# EasyEDA Pro project ProPrj_SensUs2026_ParisBioTek_PCBs.epro, board PCB_2
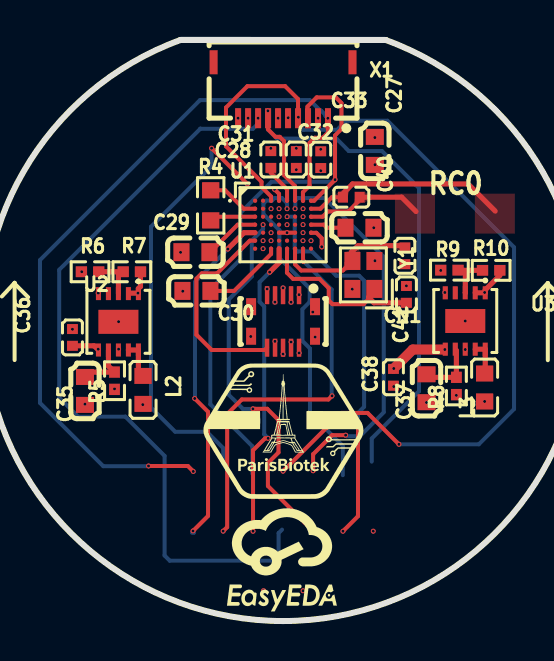
[diagram p4: board, top side]
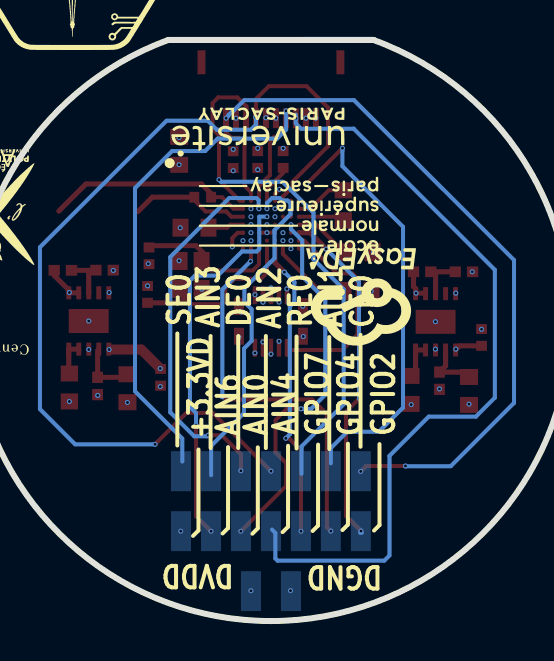
[diagram p5: board, bottom side, seen from below]

Outline 10.28 x 29.1 mm; copper layers: Top Layer, Inner1, Inner2, Inner3, Inner4, Bottom Layer. Coordinates in mm from the lower left corner of the outline.
Outline path: 0,29.1 10.28,29.09 ; 10.27,29.1 0.01,29.1 arc(5.14,0) 10.27,29.1
Stack: Top Layer 0.035mm Outer layer thickness 1oz / Dielectric1 0.0994mm 3313 RC57% 4.2mil / Inner1 0.0152mm Inner layer thickness / Dielectric2 0.55mm 0.55mm H/H No copper / Inner2 0.0152mm Inner layer thickness / Dielectric3 0.1088mm 2116 RC54% 4.9mil / Inner3 0.0152mm Inner layer thickness / Dielectric4 0.55mm 0.55mm H/H No copper / Inner4 0.0152mm Inner layer thickness / Dielectric5 0.0994mm 3313 RC57% 4.2mil / Bottom Layer 0.035mm Outer layer thickness 1oz

## Design rules (mm)
template: Custom Config
spacing copperThickness1oz (default): track to track 0.102, other pairs 0.14 to 0.3
spacing copperThickness2oz: track to track 0.203, other pairs 0.152 to 0.3
spacing copperThicknessInner0.5oz: track to track 0.089, other pairs 0.152 to 0.3
track width copperThickness1oz (default): min 0.102, default 0.254, max 2.54
track width copperThickness2oz: min 0.203, default 0.254, max 2.54
track width copperThickness0.5oz: min 0.089, default 0.254, max 2.54
differential pair differentialPair (default): width min 0.127, default 0.254, max 2.54; gap min 0.152, default 0.152
via viaSize (default): diameter min 0.2, default 0.25, max 10; hole min 0.1, default 0.15, max 6.3

## Placement (name value [footprint] x y rotation side)
C27  470nF  [C0603]  9.74 23.54 90 top
C28  4.7uF  [C0402]  4.53 23.11 270 top
C29  470nF  [C0603]  0.76 18.47 0 top
C30  470nF  [C0603]  0.81 16.53 180 top
C31  100nF  [C0402]  5.81 23.11 270 top
C32  100nF  [C0402]  7.03 23.1 270 top
C33  100nF  [C0402]  8.56 21.22 180 top
C34  470nF  [C0603]  8.97 19.69 0 top
C35  470nF  [C0603]  -4.77 11.52 270 top
C36  4.7uF  [C0402]  -5.4 14.2 270 top
C37  470nF  [C0603]  12.32 11.66 270 top
C38  4.7uF  [C0402]  10.67 12.21 90 top
C40  15pF  [C0402]  11.24 18.29 270 top
C41  15pF  [C0402]  11.32 16.36 90 top
CN1  559099872  [CONN-SMD_559099872]  5.14 15 180 top
L2  BLM18PG600SN1D  [L0603]  -1.86 11.57 270 top
L3  BLM18PG600SN1D  [L0603]  15.23 11.69 270 top
R4  100Ω  [R0603]  1.52 20.81 270 top
R5  33kΩ  [R0402]  -3.29 12.03 270 top
R6  33kΩ  [R0402]  -4.52 17.49 0 top
R7  47kΩ  [R0402]  -2.42 17.49 0 top
R8  33kΩ  [R0402]  13.82 11.77 270 top
R9  33kΩ  [R0402]  13.47 17.57 0 top
R10  47kΩ  [R0402]  15.56 17.56 0 top
U1  AD5940BCBZ-RL7  [BGA-56_L4.2-W3.6-R8-C7-P0.40-TL]  5.14 19.85 0 top
U2  LT3045EDD#TRPBF  [DFN-10_L3.0-W3.0-P0.50-BL-EP]  -3.1 14.98 180 top
U3  LT3045EDD#TRPBF  [DFN-10_L3.0-W3.0-P0.50-BL-EP]  14.26 15.02 180 top
X1  AFC48-S10FKA-HF  [FPC-SMD_AFC48-S10FKA-HF]  5.14 26.58 180 top
Y1  32MHz  [CRYSTAL-SMD_4P-L2.0-W1.6-BL]  9.16 17.33 90 top

## Footprints (pads in the part's own frame, mm; a bottom-side part is the same pattern mirrored in y, then rotated)
BGA-56_L4.2-W3.6-R8-C7-P0.40-TL
  round 0.213 smd: A1(-1.4,1.2) A2(-1,1.2) A3(-0.6,1.2) A4(-0.2,1.2) A5(0.2,1.2) A6(0.6,1.2) A7(1,1.2) A8(1.4,1.2) B1(-1.4,0.8) B2(-1,0.8) B3(-0.6,0.8) B4(-0.2,0.8) B5(0.2,0.8) B6(0.6,0.8) B7(1,0.8) B8(1.4,0.8) C1(-1.4,0.4) C2(-1,0.4) C3(-0.6,0.4) C4(-0.2,0.4) C5(0.2,0.4) C6(0.6,0.4) C7(1,0.4) C8(1.4,0.4) D1(-1.4,0) D2(-1,0) D3(-0.6,0) D4(-0.2,0) D5(0.2,0) D6(0.6,0) D7(1,0) D8(1.4,0) E1(-1.4,-0.4) E2(-1,-0.4) E3(-0.6,-0.4) E4(-0.2,-0.4) E5(0.2,-0.4) E6(0.6,-0.4) E7(1,-0.4) E8(1.4,-0.4) F1(-1.4,-0.8) F2(-1,-0.8) F3(-0.6,-0.8) F4(-0.2,-0.8) F5(0.2,-0.8) F6(0.6,-0.8) F7(1,-0.8) F8(1.4,-0.8) G1(-1.4,-1.2) G2(-1,-1.2) G3(-0.6,-1.2) G4(-0.2,-1.2) G5(0.2,-1.2) G6(0.6,-1.2) G7(1,-1.2) G8(1.4,-1.2)
C0402
  rect 0.5x0.54 smd: 1(-0.42,0) 2(0.42,0)
C0603
  rect 0.8x0.9 smd: 1(-0.7,0) 2(0.7,0)
CONN-SMD_559099872
  rect 0.22x0.9 smd: 1(-0.8,-1.315) 2(-0.4,-1.315) 3(0,-1.315) 4(0.4,-1.315) 5(0.8,-1.315) 6(0.8,1.315) 7(0.4,1.315) 8(0,1.315) 9(-0.4,1.315) 10(-0.8,1.315)
  rect 0.5x0.85 smd: 11(-1.6,0.74) 12(-1.6,-0.74) 13(1.6,-0.74) 14(1.6,0.74)
CRYSTAL-SMD_4P-L2.0-W1.6-BL
  rect 0.9x0.8 smd: 1(-0.7,-0.55) 2(0.7,-0.55) 3(0.7,0.55) 4(-0.7,0.55)
DFN-10_L3.0-W3.0-P0.50-BL-EP
  rect 0.25x0.65 smd: 1(-1,-1.411) 2(-0.5,-1.411) 3(0,-1.411) 4(0.5,-1.411) 5(1,-1.411) 6(1,1.411) 7(0.5,1.411) 8(0,1.411) 9(-0.5,1.411) 10(-1,1.411)
  rect 2x1.2 smd: 11(0,0)
FPC-SMD_AFC48-S10FKA-HF
  rect 0.3x1 smd: 1(-2.25,1.4) 2(-1.75,1.4) 3(-1.25,1.4) 4(-0.75,1.4) 5(-0.25,1.4) 6(0.25,1.4) 7(0.75,1.4) 8(1.25,1.4) 9(1.75,1.4) 10(2.25,1.4)
  rect 0.4x1.2 smd: 11(-3.475,-1.4) 12(3.475,-1.4)
L0603
  rect 0.8x0.864 smd: 1(-0.7,0) 2(0.7,0)
R0402
  rect 0.566x0.54 smd: 1(-0.433,0) 2(0.433,0)
R0603
  rect 0.806x0.864 smd: 1(-0.753,0) 2(0.753,0)

## Nets
As in the schematic.

Pads without a net: U1 A1 A2 B2 C2 C3 D3 D4 G1 G8; U2 4; U3 4; X1 11 12

## Via types
v1: diameter 0.25, hole 0.15, Top Layer to Bottom Layer, 103 vias

## Routing (per net, layer and track width the routed paths; a pad name or vN(x,y) marks a point on that pad's centre or on a via; arc(x,y) is an arc through that point)
+3.3VA: length 25.1
  Top Layer w0.102: -2.57,16.42 U2.2
  Top Layer w0.255: C36.2 -4.31,13.78 U2.6 ; v1(-2.12,16.42) -2.57,16.42 ; U2.1 -2.1,16.64 -1.99,16.75 -1.99,17.49
  Inner2 w0.5: v1(-2.12,16.42) -2.57,16.42 -4.07,14.92 -4.07,13.65 v1(-4.11,13.61) -4.11,10.07 -3.68,9.64 0.72,9.64 1.83,10.75 1.83,14.09 2.7,14.96 5.01,14.96 5.54,15.5 v1(5.54,15.97)
+3.3VD: length 25.6
  Top Layer w0.255: R10.2 15.99,17.31 15.26,16.58 U3.1 U3.2
  Top Layer w0.5: 13.13,13.6 11.63,13.6 v1(10.68,12.65)
  Inner2 w0.2: 10.72,12.65 11.48,11.88 11.48,6.32 v1(9.66,4.5)
  Inner2 w0.255: v1(13.24,13.6) 13.14,13.7 13.14,14.78 13.92,15.56 14.34,15.56 v1(15.23,16.45)
  Inner2 w0.5: v1(10.68,12.65) 4.76,12.65 4.35,13.06 4.35,13.62 v1(4.74,14.01)
AGND:
  vias: v1(-5.4,14.61) v1(-4.93,17.49) v1(-4.77,10.86) v1(-4.11,16.42) v1(-3.29,11.62) v1(-3.09,14.99) v1(-3.09,13.61) v1(0.01,18.46) v1(4.53,23.67) v1(4.54,19.45) v1(4.94,20.25) v1(5.34,19.85) v1(5.81,23.67) v1(7.03,23.62) v1(9.68,19.69) v1(9.74,24.21)
AVDD: length 16.1
  Top Layer w0.2: v1(4.72,21.62) 4.94,21.39 U1.A4
  Inner2 w0.2: v1(4.14,19.05) 3.66,19.52
  Inner2 w0.5: 2.36,19.52 3.66,19.52 3.66,19.58 3.56,19.69 3.56,20.82 4.35,21.62 v1(4.72,21.62) ; v1(-1.88,10.84) -0.95,11.77 -0.95,16.65 1.94,19.53 2.32,19.53 2.33,19.54
DGND: length 0.8
  Top Layer w0.2: U1.E4 v1(5.34,19.45) U1.E6
  vias: v1(0.13,16.52) v1(3.55,15.77) v1(3.53,14.25) v1(4.17,1.52) v1(4.35,16.63) v1(5.55,13.97) v1(5.95,13.42) v1(6.63,15.47) v1(6.75,14.22) v1(8.61,16.62) v1(9.74,18.04) v1(10.68,11.74) v1(11.28,17.89) v1(11.32,16.78) v1(12.32,10.94) v1(13.03,17.56) v1(13.24,16.45) v1(13.81,11.3) v1(14.26,15.02) v1(14.26,13.6)
DVDD: length 29.3
  Inner2 w0.2: v1(4.14,18.65) 4.54,18.65 v1(4.54,19.05) ; v1(6.15,1.52) 8.85,1.52 12.23,4.9 12.23,7.99 v1(15.23,10.99)
  Inner2 w0.5: 4.64,18.54 8.4,14.78 11.17,14.78 14.95,10.99 v1(15.23,10.99)
AIN0: length 27.9
  Top Layer w0.2: v1(3.64,10.63) 4.35,10.63 4.92,10.06 4.92,8.44 4.39,7.91 4.39,6.76 v1(6.65,4.5)
  Inner3 w0.2: v1(4.14,19.85) 3.89,19.85 2.03,21.7 2.03,25.86 2.19,26.02 2.8,26.02 3.39,25.42 v1(3.39,25.18)
  Bottom Layer w0.2: 3.65,10.62 3.14,10.62 2.42,11.33 2.42,16.1 3.58,17.26 3.58,19.06 4.14,19.62 v1(4.14,19.85)
AIN1: length 32.7
  Top Layer w0.2: v1(3.36,21.89) 1.57,23.68
  Inner3 w0.102: v1(4.54,20.65) 4.54,20.7
  Inner3 w0.2: 4.54,20.7 4.46,20.7 3.36,21.8 v1(3.36,21.89) ; v1(6.89,25.18) 5.09,26.99 2.39,26.99 1.57,26.16 v1(1.57,23.68)
  Bottom Layer w0.2: v1(1.57,23.68) 1.57,22.77 -1.47,19.74 -1.47,10.69 -0.25,9.48 1.33,9.48 2.15,8.66 2.15,7.89
AIN2: length 47.2
  Top Layer w0.2: v1(10.94,8.85) 9.37,10.42 8.06,10.42 v1(5.14,7.5) ; X1.4 5.89,26.13 5.25,26.78 3.36,26.78 2.29,25.71 2.29,23.77 4.07,21.99 4.07,21.73 4.54,21.26 U1.A3
  Bottom Layer w0.2: v1(5.91,25.23) 5.89,25.21 5.89,24.85 6.15,24.6 7.85,24.6 8.3,25.05 10.37,25.05 16.7,18.72 16.7,10.61 14.94,8.85 v1(10.94,8.85)
AIN3: length 22
  Inner3 w0.102: 5.34,20.65 v1(5.34,20.65)
  Inner3 w0.2: v1(4.89,25.18) 4.89,23.84 4.91,23.83 4.91,21.99 5.34,21.56 5.34,20.65
  Bottom Layer w0.2: 5.17,17.97 6.47,16.66 6.47,15.98 6.11,15.61 6.11,14.03 6.49,13.65 6.49,10.39 ; 5.16,17.97 4.96,18.17 4.96,19.57 4.16,20.37 4.16,20.91 4.31,21.06 4.59,21.06 4.71,21.18 5.09,21.18 5.34,20.93 v1(5.34,20.65) ; 6.5,10.4 8.14,8.77 8.14,7.3
AIN4: length 43.7
  Inner3 w0.2: v1(3.89,25.18) 4.07,25 4.07,21.81 4.27,21.61 4.27,21.45 4.92,20.8 4.92,20.68 4.94,20.66
  Bottom Layer w0.2: v1(3.89,25.18) 3.9,25.18 ; 3.9,25.18 3.9,24.91 3.63,24.65 1,24.65 ; 3.9,25.18 3.9,25.35 ; 5.09,4.58 4.92,4.41 4.92,3.13 4.81,3.02 -0.53,3.02 -0.79,3.28 -0.79,8.27 -2.75,10.24 -5.12,10.24 -6.06,11.18 -6.06,17.59 1.01,24.66
  vias: v1(4.94,20.65)
AIN6: length 28.7
  Top Layer w0.2: v1(8.14,4.5) 8.89,5.25 v1(8.89,9.81)
  Inner3 w0.2: v1(2.89,25.18) 2.64,24.93 2.64,21.89 4.69,19.85 4.89,19.85 4.97,19.77 4.97,19.15 5.09,19.03 5.7,19.03 5.76,19.09 5.76,20.14 5.65,20.25 v1(5.34,20.25)
  Bottom Layer w0.2: v1(8.89,9.81) 8.89,10.42 9.2,10.72 9.2,17.04 8.95,17.29 7.81,17.29 6.59,18.51 5.86,18.51 5.73,18.63 5.73,20.24 5.72,20.25 v1(5.34,20.25)
CE0: length 39.3
  Top Layer w0.2: v1(0.65,7.49) 0.38,7.76 v1(-1.59,7.76) ; U1.A7 6.14,21.05 6.14,21.47 6.47,21.8 6.47,23.94 6.72,24.2 7.13,24.2 7.39,24.46 X1.1
  Bottom Layer w0.2: v1(7.39,25.18) 7.27,25.29 7.27,25.33 7.05,25.55 7.01,25.55 6.48,26.08 0.99,26.08 -7.02,18.07 -7.02,10.92 -3.85,7.75 -1.6,7.75 -1.59,7.74
CS: length 2.8
  Inner3 w0.2: v1(5.14,16.68) 5.64,17.18 5.64,18.2 6.14,18.7 v1(6.14,19.05)
DE0: length 23.9
  Top Layer w0.2: v1(8.28,9.31) 7.6,9.31 6.65,8.35 v1(6.65,7.52)
  Inner3 w0.2: v1(5.74,20.65) 5.74,21.79 5.4,22.13 v1(5.4,25.2)
  Bottom Layer w0.2: v1(8.28,9.31) 8.33,9.25 8.98,9.25 10.18,10.45 10.18,18.23 7.23,21.18 5.87,21.18 5.76,21.07 5.76,20.66 v1(5.74,20.65)
GPIO2: length 17.2
  Top Layer w0.2: v1(0.72,11.15) 1.39,10.48 1.39,5.26 v1(0.64,4.51)
  Top Layer w0.255: 2.38,18.64 3.19,19.45 U1.E1
  Bottom Layer w0.2: v1(0.72,11.15) 0.74,11.16 0.74,16.98 v1(2.38,18.63) ; 0.59,4.42 0.68,4.42
GPIO4: length 19.7
  Top Layer w0.2: U1.G7 6.14,18.03 v1(6.17,18.01) ; v1(7.6,11.28) 7.41,11.1 3.08,11.1 2.35,10.36 2.35,4.7 v1(2.15,4.5)
  Bottom Layer w0.2: v1(7.6,11.28) 7.6,11.23 7.58,11.21 7.58,16.6 v1(6.17,18.01)
GPIO7: length 15.1
  Top Layer w0.2: v1(4.4,9.15) 4.24,9.15 3.64,8.55 v1(3.64,4.5)
  Top Layer w0.255: v1(4.47,17.47) 4.94,17.94 U1.G4
  Bottom Layer w0.2: v1(4.4,9.15) 4.2,9.35 4.2,15.75 3.97,15.98 3.97,16.97 v1(4.47,17.47)
MISO: length 6.1
  Top Layer w0.2: 7.08,18.71 7.08,19.17 6.81,19.44 6.55,19.44 U1.E8
  Inner3 w0.2: v1(7.08,18.74) 7.08,16.82 5.82,15.57 5.14,15.57 v1(4.74,15.97)
MOSI: length 10.3
  Inner3 w0.2: v1(6.14,19.45) 7.28,19.45 7.64,19.08 7.64,13.39 ; v1(5.14,13.37) 5.75,12.76 7.03,12.76 7.64,13.37
RC0_0: length 6
  Top Layer w0.2: U1.C8 7.12,20.25 7.39,20.51 8.41,20.51 8.98,21.08 C33.1
  Top Layer w0.255: C33.1 11.08,21.22 11.8,20.5
RC0_1: length 10.5
  Top Layer w0.2: C33.2 7.59,21.22 7.01,20.65 U1.B8
  Top Layer w0.255: C33.2 8.07,21.3 8.07,21.33 8.62,21.89 14.4,21.89 15.76,20.53
RE0: length 28.2
  Top Layer w0.2: U1.A8 6.7,21.05 7.74,22.09 7.74,24.31 8.07,24.64 8.07,25.94 7.78,26.22 6.83,26.22 6.37,25.76 6.37,25.2 X1.3
  Bottom Layer w0.2: v1(7.75,22.1) 7.64,21.99 4.56,21.99 3.01,20.45 3.01,18.12 1.5,16.61 1.5,10.85 3.61,8.75 3.61,7.37
RESET: length 10.4
  Top Layer w0.2: CN1.6 4.23,13.57 1.57,13.57 0.81,14.34 0.81,17.14 1.07,17.41 1.84,17.41 3.48,19.05 U1.F1
SCLK: length 2.9
  Inner3 w0.2: 5.95,16.35 6.54,16.94 v1(6.54,19.05)
  vias: v1(5.94,16.34)
SE0: length 29.2
  Top Layer w0.2: X1.7 4.4,25.17 4.4,24.61 4.76,24.24 4.98,24.24 5.19,24.03 5.19,22.33 5.74,21.78 U1.A6
  Bottom Layer w0.2: v1(4.38,25.55) 4.38,24.61 4.84,24.16 7.81,24.16 8.44,23.53 10.09,23.53 11.95,21.68 11.95,11.51 9.58,9.14 9.58,7.98
X0: length 7.3
  Top Layer w0.2: Y1.3 8.14,17.55 6.05,17.55 5.74,17.86 U1.G6
  Top Layer w0.255: C40.1 11.15,18.8 8.9,18.8 8.56,18.46 8.56,18.08 Y1.3
X1: length 9.1
  Top Layer w0.102: Y1.1 9.71,16.51 9.42,16.21
  Top Layer w0.2: 9.42,16.21 9.42,16.11 9.17,15.87 7.61,15.87 7.43,16.05 7.43,16.67 6.97,17.13 5.65,17.13 5.34,17.44 U1.G5
  Top Layer w0.255: 9.42,16.21 9.69,15.94 C41.1
$1N2048: length 4.8
  Inner3 w0.2: v1(9.74,22.85) 9.47,22.85 6.47,19.85 v1(6.14,19.85)
$1N2152: length 1.9
  Top Layer w0.2: 4.53,22.56 4.53,22.44 5.34,21.63 U1.A5
$1N2188: length 2.9
  Top Layer w0.2: C29.2 1.49,18.47 2.87,19.85 U1.D1
$1N2486: length 4.1
  Top Layer w0.2: C30.1 2.69,16.53 4.54,18.38 U1.G3
$1N2550: length 2.1
  Inner3 w0.2: v1(6.14,20.65) 6.14,21.85 5.81,22.19 v1(5.81,22.6)
$1N3554: length 2.8
  Inner3 w0.2: v1(6.14,20.25) 6.36,20.25 7.03,20.92 v1(7.03,22.55)
$1N3572: length 2.6
  Top Layer w0.2: U1.B1 3.17,20.65 2.25,21.57 R4.1
$1N3580: length 2.3
  Top Layer w0.2: U1.C1 1.71,20.25 R4.2
$1N4271: length 1.8
  Top Layer w0.2: U1.D8 7.18,19.85 7.34,19.69 C34.1
$1N7940: length 1.9
  Top Layer w0.255: L2.1 -2.1,12.51 U2.10 U2.9
$1N7995: length 2.8
  Top Layer w0.255: C35.1 -4.53,12.47 R5.1 -3.6,12.77 U2.7
$1N8461: length 2.3
  Top Layer w0.102: -3.1,17.43 -3.04,17.49
  Top Layer w0.255: U2.3 -3.1,17.43 ; R6.2 R7.1
$1N8870: length 1.7
  Top Layer w0.102: 15.26,12.43 L3.1
  Top Layer w0.255: U3.9 U3.10 15.26,12.43
$1N8877: length 3
  Top Layer w0.102: 13.82,13.56 U3.7
  Top Layer w0.255: 13.82,13.56 R8.1 12.48,12.2 C37.1
$1N8893: length 2.3
  Top Layer w0.102: 14.21,17.52 14.25,17.56
  Top Layer w0.255: 14.21,17.52 14.27,17.47 14.27,16.44 U3.3 ; 14.25,17.56 R10.1 ; R9.2 14.16,17.57

## Copper pours and planes (outline as drawn; the poured copper is in the pictures)
+3.3VD on Bottom Layer: 9.14,5.5 10.14,5.5 10.14,3.5 9.14,3.5
AGND on Inner1: 19.84,15.35 19.8,16.07 19.73,16.8 19.63,17.51 19.48,18.23 19.31,18.93 19.1,19.62 18.85,20.31 18.58,20.98 18.27,21.63 17.92,22.27 17.55,22.89 17.15,23.5 16.72,24.08 16.26,24.64 15.77,25.18 15.26,25.69 14.72,26.18 14.16,26.64 13.58,27.07 12.97,27.47 12.35,27.84 11.71,28.19 11.06,28.5 10.39,28.77 9.7,29.02 9.01,29.23 8.3,29.41 7.59,29.55 6.88,29.65 6.15,29.72 5.43,29.76 4.7,29.76 3.98,29.72 3.26,29.65 2.54,29.55 1.83,29.41 1.13,29.23 0.43,29.02 -0.25,28.77 -0.92,28.5 -1.58,28.19 -2.22,27.84 -2.84,27.47 -3.44,27.07 -4.02,26.64 -4.58,26.18 -5.12,25.69 -5.63,25.18 -6.12,24.64 -6.58,24.08 -7.01,23.5 -7.42,22.89 -7.79,22.27 -8.13,21.63 -8.44,20.98 -8.72,20.31 -8.96,19.62 -9.17,18.93 -9.35,18.23 -9.49,17.51 -9.6,16.8 -9.67,16.07 -9.7,15.35 -9.7,14.63 -9.67,13.9 -9.6,13.18 -9.49,12.46 -9.35,11.75 -9.17,11.05 -8.96,10.35 -8.72,9.67 -8.44,9 -8.13,8.34 -7.79,7.7 -7.42,7.08 -7.01,6.48 -6.58,5.9 -6.12,5.34 -5.63,4.8 -5.12,4.29 -4.58,3.8 -4.02,3.34 -3.44,2.91 -2.84,2.5 -2.22,2.13 -1.58,1.79 -0.92,1.48 -0.25,1.2 0.43,0.96 1.13,0.75 1.83,0.57 2.54,0.43 3.26,0.32 3.98,0.25 4.7,0.22 5.43,0.22 6.15,0.25 6.88,0.32 7.59,0.43 8.3,0.57 9.01,0.75 9.7,0.96 10.39,1.2 11.06,1.48 11.71,1.79 12.35,2.13 12.97,2.5 13.58,2.91 14.16,3.34 14.72,3.8 15.26,4.29 15.77,4.8 16.26,5.34 16.72,5.9 17.15,6.48 17.55,7.08 17.92,7.7 18.27,8.34 18.58,9 18.85,9.67 19.1,10.35 19.31,11.05 19.48,11.75 19.63,12.46 19.73,13.18 19.8,13.9 19.84,14.63
DGND on Bottom Layer: 3.64,2.5 4.64,2.5 4.64,0.5 3.64,0.5
DGND on Inner4: 20.09,15.35 20.05,16.08 19.98,16.81 19.87,17.54 19.73,18.26 19.55,18.97 19.34,19.67 19.09,20.36 18.81,21.03 18.5,21.69 18.15,22.34 17.78,22.97 17.37,23.58 16.93,24.16 16.47,24.73 15.98,25.27 15.46,25.79 14.92,26.28 14.35,26.75 13.76,27.18 13.15,27.59 12.53,27.97 11.88,28.31 11.22,28.62 10.54,28.9 9.85,29.15 9.15,29.36 8.44,29.54 7.72,29.68 7,29.79 6.27,29.86 5.54,29.9 4.81,29.9 4.08,29.86 3.35,29.79 2.62,29.68 1.91,29.54 1.2,29.36 0.5,29.15 -0.19,28.9 -0.87,28.62 -1.53,28.31 -2.18,27.97 -2.81,27.59 -3.41,27.18 -4,26.75 -4.57,26.28 -5.11,25.79 -5.63,25.27 -6.12,24.73 -6.58,24.16 -7.02,23.58 -7.43,22.97 -7.8,22.34 -8.15,21.69 -8.46,21.03 -8.74,20.36 -8.99,19.67 -9.2,18.97 -9.38,18.26 -9.52,17.54 -9.63,16.81 -9.7,16.08 -9.74,15.35 -9.74,14.62 -9.7,13.89 -9.63,13.16 -9.52,12.44 -9.38,11.72 -9.2,11.01 -8.99,10.31 -8.74,9.62 -8.46,8.94 -8.15,8.28 -7.8,7.64 -7.43,7.01 -7.02,6.4 -6.58,5.81 -6.12,5.24 -5.63,4.7 -5.11,4.18 -4.57,3.69 -4,3.23 -3.41,2.79 -2.81,2.39 -2.18,2.01 -1.53,1.66 -0.87,1.35 -0.19,1.07 0.5,0.82 1.2,0.61 1.91,0.43 2.62,0.29 3.35,0.18 4.08,0.11 4.81,0.08 5.54,0.08 6.27,0.11 7,0.18 7.72,0.29 8.44,0.43 9.15,0.61 9.85,0.82 10.54,1.07 11.22,1.35 11.88,1.66 12.53,2.01 13.15,2.39 13.76,2.79 14.35,3.23 14.92,3.69 15.46,4.18 15.98,4.7 16.47,5.24 16.93,5.81 17.37,6.4 17.78,7.01 18.15,7.64 18.5,8.28 18.81,8.94 19.09,9.62 19.34,10.31 19.55,11.01 19.73,11.72 19.87,12.44 19.98,13.16 20.05,13.89 20.09,14.62
DVDD on Bottom Layer: 5.64,2.5 6.64,2.5 6.64,0.5 5.64,0.5
AIN0 on Bottom Layer: 6.14,5.5 7.14,5.5 7.14,3.5 6.14,3.5
AIN1 on Bottom Layer: 1.64,8.5 2.64,8.5 2.64,6.5 1.64,6.5
AIN2 on Bottom Layer: 4.64,8.5 5.64,8.5 5.64,6.5 4.64,6.5
AIN3 on Bottom Layer: 7.64,8.5 8.64,8.5 8.64,6.5 7.64,6.5
AIN4 on Bottom Layer: 4.64,5.5 5.64,5.5 5.64,3.5 4.64,3.5
AIN6 on Bottom Layer: 7.64,5.5 8.64,5.5 8.64,3.5 7.64,3.5
CE0 on Bottom Layer: 0.14,8.5 1.14,8.5 1.14,6.5 0.14,6.5
DE0 on Bottom Layer: 6.14,8.5 7.14,8.5 7.14,6.5 6.14,6.5
GPIO2 on Bottom Layer: 0.14,5.5 1.14,5.5 1.14,3.5 0.14,3.5
GPIO4 on Bottom Layer: 1.64,5.5 2.64,5.5 2.64,3.5 1.64,3.5
GPIO7 on Bottom Layer: 3.14,5.5 4.14,5.5 4.14,3.5 3.14,3.5
RC0_0 on Top Layer: 10.74,21.4 12.74,21.4 12.74,19.4 10.74,19.4
RC0_1 on Top Layer: 14.74,21.4 16.74,21.4 16.74,19.4 14.74,19.4
RE0 on Bottom Layer: 3.14,8.5 4.14,8.5 4.14,6.5 3.14,6.5
SE0 on Bottom Layer: 9.14,8.5 10.14,8.5 10.14,6.5 9.14,6.5

Small or netless copper shapes (teardrops, artwork), in the pictures only: 49 on Top Layer, 15 on Bottom Layer, 4 on Inner2, 7 on Inner3

## Text on the board
Bottom Silkscreen Layer: DGND | DVDD | GPIO2 | CE0 | GPIO4 | AIN1 | GPIO7 | RE0 | AIN4 | AIN2 | AIN0 | DE0 | AIN6 | AIN3 | +3.3VD | SE0
Top Silkscreen Layer: RC0
